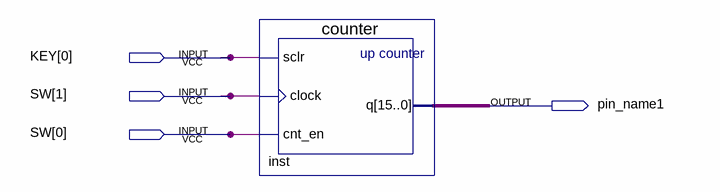
[diagram p0: schematic sheet]
// Quartus schematic lab2_4.bdf as structural Verilog: 1 symbols, 4 pins
module lab2_4 (
  input  [0:0] KEY,
  input  [1:0] SW,
  output pin_name1
);

  wire [15:0] inst_q;

  counter inst (.sclr(KEY[0]), .clock(SW[1]), .cnt_en(SW[0]), .q(inst_q));
endmodule
